# Altium project Karta_Radiowa_ILS_TETRA.PrjPcb (part 7 of 9)

## Sheet Tor_330MHz.SchDoc
size A3; Organization: Altium Limited; Address1: L3, 12a Rodborough Rd; Address2: Frenchs Forest; Address3: NSW; Address4: Australia 2086; SheetNumber: 17; SheetTotal: 17
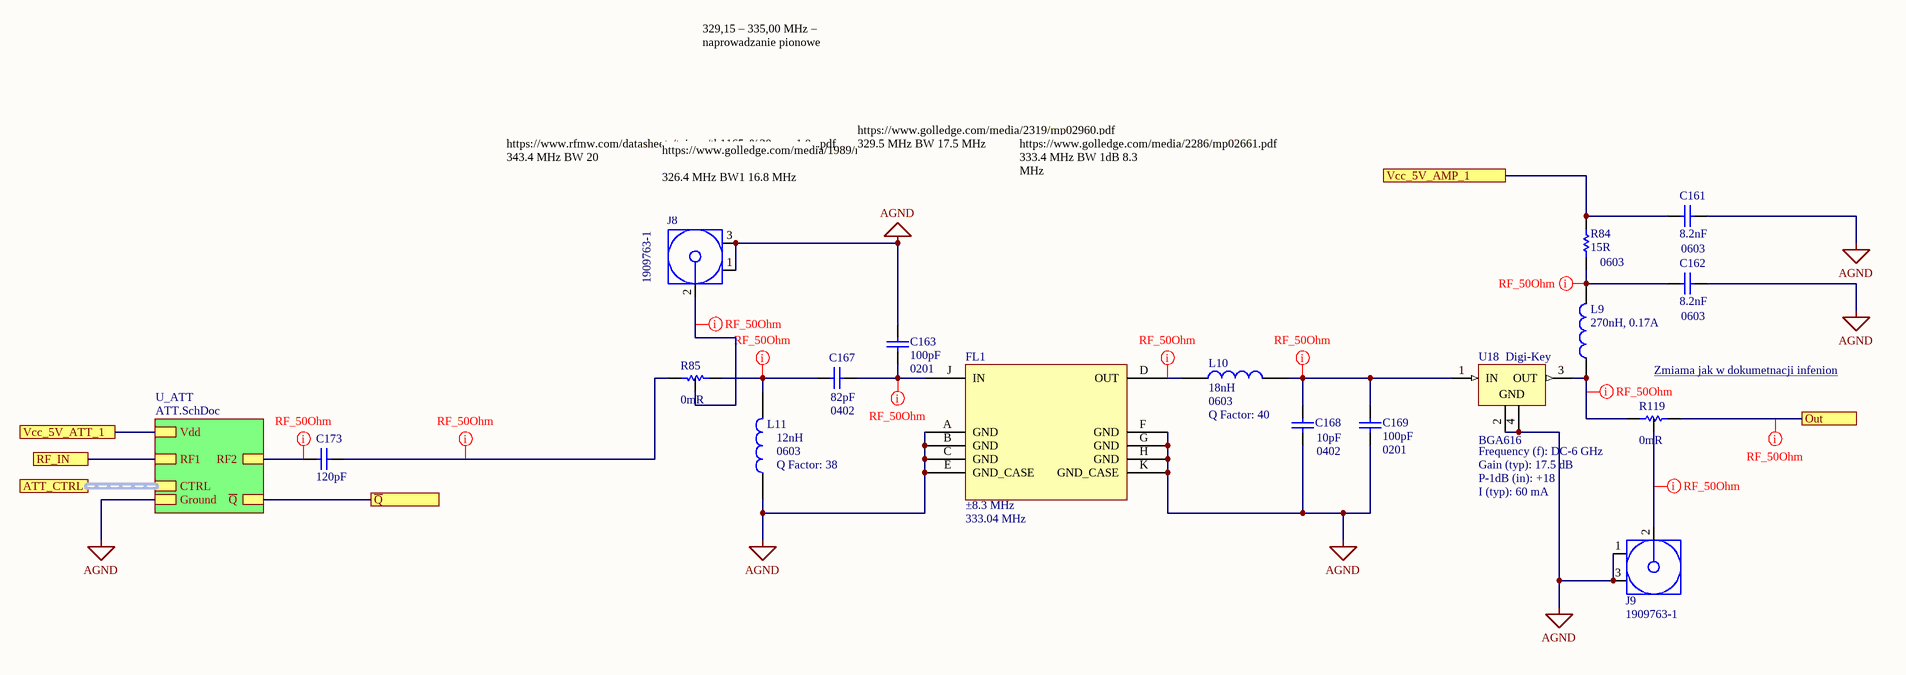
[diagram p9: Tor_330MHz.SchDoc]

### Parts
C161  8.2nF  Case/Package: 0603  [CAP 0603/1608 RF]
C162  8.2nF  Case/Package: 0603  [CAP 0603/1608 RF]
C163  100pF  Case/Package: 0201  [CAP 0201/0603 KK]
C167  82pF  Case/Package: 0402  [CAP 0402/1005 RF KK]
C168  10pF  Case/Package: 0402  [CAP 0402/1005 RF KK]
C169  100pF  Case/Package: 0201  [CAP 0201/0603 KK]
C173  120pF  [CAP 0402/1005 RF KK]
FL1  Bandwidth 1dB: ±8.3 MHz  Center frequency: 333.04 MHz  [TB0787A]  (hidden comment: SAW TB0787A)
J8  1909763-1  [TECO-1909763-1_V]
J9  1909763-1  [TECO-1909763-1_V]
L9  270nH, 0.17A  [WE-KI_0603]
L10  18nH  Case/Package: 0603  Q Factor: 40  [FB0603]
L11  12nH  Case/Package: 0603  Q Factor: 38  [FB0603]
R84  15R  Case/Package: 0603  [RES 0603/1608 RF]
R85  0mR  [RES 0402/1005 RF - 3-PADS]
R119  0mR  [RES 0402/1005 RF - 3-PADS]
U18  BGA616  Frequency (f): DC-6 GHz  Gain (typ): 17.5 dB  I (typ): 60 mA  P-1dB (in): +18  Supplier 2: Digi-Key  [INF-SOT343_V]

### Sub-sheets
U_ATT = ATT.SchDoc: Vdd, Ground, RF1, RF2, CTRL (harness ATT_Controle), ~{Q}

### Ports
ATT_CTRL, Out, RF_IN, Vcc_5V_AMP_1, Vcc_5V_ATT_1, ~{Q}

### Nets
AGND: C161.2 C162.2 C163.1 C168.1 C169.1 FL1.A(GND) FL1.B(GND) FL1.C(GND) FL1.E(GND_CASE) FL1.F(GND) FL1.G(GND) FL1.H(GND) FL1.K(GND_CASE) J8.1 J8.3 J9.1 J9.3 L11.1 U18.2(GND) U18.4(GND) ; sheet U_ATT/Ground  [project net GND_ATT]
~{Q}: port ~{Q}, sheet U_ATT/~{Q}
Vcc_5V_AMP_2: C161.1 R84.2 ; port Vcc_5V_AMP_1
Vcc_5V_ATT_2: port Vcc_5V_ATT_1, sheet U_ATT/Vdd
NetC162_1: C162.1 L9.2 R84.1
NetC163_2: C163.2 C167.2 FL1.J(IN)
NetC164_1: R119.1 ; port Out
NetC167_1: C167.1 L11.2 R85.2
NetC168_2: C168.2 C169.2 L10.2 U18.1(IN)
NetC173_1: C173.1 ; sheet U_ATT/RF2
NetC173_2: C173.2 R85.1
NetFL1_D: FL1.D(OUT) L10.1
NetJ8_2: J8.2 R85.3
NetJ9_2: J9.2 R119.3
NetL9_1: L9.1 R119.2 U18.3(OUT)
NetR9_U_RF_ANT_M_2: port RF_IN, sheet U_ATT/RF1

### Buses and harness runs
harness port ATT_CTRL = sheet U_ATT/CTRL

### Layout directives
net class Single50: NetC162_1, NetC163_2, NetC164_1, NetC167_1, NetC168_2, NetC173_1, NetC173_2, NetFL1_D, NetJ8_2, NetJ9_2, NetL9_1

### Notes on the sheet
- 329,15 – 335,00 MHz – naprowadzanie pionowe
- https://www.golledge.com/media/2319/mp02960.pdf
  329.5 MHz BW 17.5 MHz
- https://www.rfmw.com/datasheets/taisaw/tb1165a%20_rev.1.0_.pdf
  343.4 MHz BW 20
- (near J8) https://www.golledge.com/media/1989/ma08024.pdf
  326.4 MHz BW1 16.8 MHz
- https://www.golledge.com/media/2286/mp02661.pdf
  333.4 MHz BW 1dB 8.3 MHz
- (near R119) Zmiama jak w dokumetnacji infenion <https://www.infineon.com/dgdl/AN098.pdf?fileId=db3a30431441fb5d0114b6641c751744>
- Title
- Size:
- Date:
- A3
- Number:
- Time:
- Revision:
- Sheet
- of
- File:

### Library data of the parts
C161 C162 = Capacitor: Multilayer Ceramic Capacitors MLCC - SMD/SMT 0603 8,200pF 50volts C0G +/-5%; Manufacturer: Murata; Manufacturer Part Number: GRM1885C1H822JA01D; Voltage Rating: 50V; Tolerance: 5%; Supplier 1: Digi-Key; Supplier Part Number 1: 490-11482-1-ND; RoHS: Yes; Category: Ceramic Capacitors; Stock 1: 65615; Pricing 1: 1=0,21000, 10=0,14200, 50=0,08500, 100=0,07170, 500=0,04908, 1000=0,04341 (USD); Mount: Surface Mount; Case Code (Imperial): 0603; Case Code (Metric): 1608; Min Operating Temperature: -55°C; Max Operating Temperature: 125°C; Dielectric: C0G; Capacitance: 8.2nF; Voltage Rating (DC): 50V; Packaging: Tape and Reel; Package Quantity: 4000; Termination: SMD/SMT; Length: 0.063inch; Height: 0.8mm; Width: 0.031inch; Thickness: 0.035inch; ComponentLink1URL: https://datasheet.ciiva.com/29537/partnumbering-e-01-29537913.pdf?src-supplier=Digi-Key; ComponentLink1Description: https://datasheet.ciiva.com/29537/partnumbering-e-01-29537913.pdf?src-supplier=Digi-Key
C163 C169 = Capacitor: Multilayer Ceramic Capacitors MLCC - SMD/SMT 0201 100pF 25volts C0G +/-5%; Manufacturer: Murata; Manufacturer Part Number: GRM0335C1E101JA01D; Tolerance: 5%; Voltage: 25V; Supplier 1: Digi-Key; Supplier Part Number 1: 490-3160-1-ND; RoHS: Yes; Category: Ceramic Capacitors; Stock 1: 270262; Pricing 1: 1=0,10000, 10=0,01300, 100=0,00560, 500=0,00400, 1000=0,00315, 2500=0,00286, 5000=0,00263 (USD); Mount: Surface Mount; Case Code (Metric): 0603; Case Code (Imperial): 0201; Min Operating Temperature: -55°C; Max Operating Temperature: 125°C; Dielectric: C0G; Capacitance: 100pF; Termination: SMD/SMT; Package Quantity: 15000; Packaging: Tape and Reel; Voltage Rating: 25V; Voltage Rating (DC): 25V; Length: 0.6mm; Height: 0.3mm; Thickness: 0.013inch; Depth: 0.3mm; Width: 0.012inch; Radiation Hardening: No; REACH SVHC: No SVHC; Lead Free: Lead Free; ComponentLink1URL: https://datasheet.ciiva.com/16497/grm0335c1e101ja01-01-16497112.pdf?src-supplier=Future+Electronics; ComponentLink1Description: https://datasheet.ciiva.com/16497/grm0335c1e101ja01-01-16497112.pdf?src-supplier=Future+Electronics; ComponentLink2URL: https://datasheet.ciiva.com/18697/product-18697797.pdf?src-supplier=Digi-Key; ComponentLink2Description: https://datasheet.ciiva.com/18697/product-18697797.pdf?src-supplier=Digi-Key
C167 = Capacitor: CERAMIC CAPACITOR, 82PF, 25V, C0G/NP0, 0402; Product Range:VJ HIFREQ Series; Capacitance:82pF; Capacitance Tolerance: 5%; Dielectric Characteristic:C0G / NP0; Voltage Rating:25V; Ceramic Capacitor Case:0402 [1005 Metric] ;RoHS Compliant: Yes; Manufacturer: Vishay Vitramon; Manufacturer Part Number: VJ0402D820JXXAJ; Dielectric: C0G; Temperature Coefficient: 30ppm/°C; Supplier 1: Digi-Key; Supplier Part Number 1: 720-1297-1-ND; RoHS: Yes; Category: Ceramic Capacitors; Stock 1: 90328; Pricing 1: 1=0,52000, 10=0,36500, 50=0,27620, 100=0,24060, 500=0,17820 (USD); Mount: Surface Mount,PCB; Weight: 2.3E-05oz; Case Code (Imperial): 0402; Case Code (Metric): 1005; Min Operating Temperature: -55°C; Max Operating Temperature: 125°C; Packaging: Tape and Reel; Package Quantity: 1; Termination: SMD/SMT; Capacitance: 82pF; Tolerance: 5%; Voltage Rating: 25V; Voltage Rating (DC): 25V; Voltage: 25V; Length: 1.02mm; Height: 0.61mm; Width: 0.51mm; Thickness: 0.024inch; Depth: 0.51mm; Radiation Hardening: No; REACH SVHC: Unknown; Lead Free: Lead Free; ComponentLink1URL: https://datasheet.ciiva.com/30503/0900766b812428e7-30503890.pdf?src-supplier=RSComponents; ComponentLink1Description: https://datasheet.ciiva.com/30503/0900766b812428e7-30503890.pdf?src-supplier=RSComponents; ComponentLink2URL: https://datasheet.ciiva.com/16511/vj0402dseries-16511415.pdf?src-supplier=Future+Electronics; ComponentLink2Description: https://datasheet.ciiva.com/16511/vj0402dseries-16511415.pdf?src-supplier=Future+Electronics; ComponentLink3URL: https://datasheet.ciiva.com/6286/vjhifreq-6286552.pdf?src-supplier=Digi-Key; ComponentLink3Description: https://datasheet.ciiva.com/6286/vjhifreq-6286552.pdf?src-supplier=Digi-Key; ComponentLink4URL: https://datasheet.ciiva.com/7974/1631376-7974937.pdf?src-supplier=Element14; ComponentLink4Description: https://datasheet.ciiva.com/7974/1631376-7974937.pdf?src-supplier=Element14; ComponentLink5URL: https://datasheet.ciiva.com/6286/vjhifreq-6286555.pdf?src-supplier=Digi-Key; ComponentLink5Description: https://datasheet.ciiva.com/6286/vjhifreq-6286555.pdf?src-supplier=Digi-Key; ComponentLink6URL: https://datasheet.ciiva.com/49031/70396551-49031980.pdf?src-supplier=Allied+Electronics; ComponentLink6Description: https://datasheet.ciiva.com/49031/70396551-49031980.pdf?src-supplier=Allied+Electronics; ComponentLink7URL: https://datasheet.ciiva.com/6286/vjhifreq-6286558.pdf?src-supplier=Digi-Key; ComponentLink7Description: https://datasheet.ciiva.com/6286/vjhifreq-6286558.pdf?src-supplier=Digi-Key
C168 = Capacitor: KEMET - CBR04C100F5GAC - Capacitor, RF, 10 pF, 50 V, HiQ-CBR Series, ± 1%, 125 °C, 0402 [1005 Metric]; Voltage Rating: 50V; Dielectric: C0G; Supplier 1: Digi-Key; Supplier Part Number 1: 399-8805-1-ND; Manufacturer: KEMET; Manufacturer Part Number: CBR04C100F5GAC; RoHS: Yes; Category: Ceramic Capacitors; Stock 1: 134697; Pricing 1: 1=0,23000, 10=0,15500, 50=0,09300, 100=0,07860, 500=0,05376, 1000=0,04756, 2500=0,04550, 5000=0,04136 (USD); Mount: Surface Mount; Case Code (Metric): 1005; Case Code (Imperial): 0402; Min Operating Temperature: -55°C; Max Operating Temperature: 125°C; Package Quantity: 10000; Capacitance: 10pF; Tolerance: 1%; Packaging: Cut Tape; Voltage Rating (DC): 50V; Length: 0.039inch; Width: 0.02inch; Thickness: 0.022inch; REACH SVHC: No SVHC; ComponentLink1URL: https://datasheet.ciiva.com/6276/kem-c1030-cbr-smd-6276869.pdf?src-supplier=Digi-Key; ComponentLink1Description: https://datasheet.ciiva.com/6276/kem-c1030-cbr-smd-6276869.pdf?src-supplier=Digi-Key; ComponentLink2URL: https://datasheet.ciiva.com/6276/kem-c1030-cbr-smd-6276872.pdf?src-supplier=Digi-Key; ComponentLink2Description: https://datasheet.ciiva.com/6276/kem-c1030-cbr-smd-6276872.pdf?src-supplier=Digi-Key; ComponentLink3URL: https://datasheet.ciiva.com/6276/kem-c1030-cbr-smd-6276875.pdf?src-supplier=Digi-Key; ComponentLink3Description: https://datasheet.ciiva.com/6276/kem-c1030-cbr-smd-6276875.pdf?src-supplier=Digi-Key
C173 = Capacitor: CAP CER 120PF 25V C0G/NP0 0402; Manufacturer: KEMET; Manufacturer Part Number: C0402C121J3GAC7867; Tolerance: 5%; Supplier 1: Digi-Key; Supplier Part Number 1: 399-14880-1-ND; RoHS: No; Category: Ceramic Capacitors; Stock 1: 43311; Pricing 1: 1=0,10000, 10=0,04100, 50=0,02260, 100=0,01840, 500=0,01312, 1000=0,01032, 2500=0,00938, 5000=0,00863 (USD); Mount: Surface Mount; Case/Package: 0402; Case Code (Imperial): 0402; Case Code (Metric): 1005; Min Operating Temperature: -55°C; Max Operating Temperature: 125°C; Packaging: Tape and Reel; Capacitance: 120pF; Voltage Rating: 25V; ComponentLink1URL: https://api.kemet.com/component-edge/download/datasheet/C0402C121J3GAC7867.pdf?src-supplier=Digi-Key; ComponentLink1Description: https://api.kemet.com/component-edge/download/datasheet/C0402C121J3GAC7867.pdf?src-supplier=Digi-Key
FL1 = SAW TB0787A: SAW Filter 333.04MHz / Model: TB0787A / Part No: MP02661; Source Power: 10 dBm; ComponentLink1Description: Datasheet; ComponentLink1URL: https://www.golledge.com/media/2286/mp02661.pdf
J8 J9 = 1909763-1: Ultra Miniature Coaxial Connector Jack, 60 V, 50 Ohm, -40 to 90 degC, RoHS, Tape and Reel; Brand: TE Connectivity / AMP; Maximum Frequency: 6 GHz; Gender: Jack (Female); Body Material: Liquid Crystal Polymer (LCP); RF Series: UMCC; Impedance: 50 Ohms; DatasheetVersion: Rev. B2; PackageReference: SMD; PackageDescription: 3-Pin Surface Mount Device, Body 2.6 x 2.6 mm; Supplier 1: Newark; Supplier Part Number 1: 62X0488; Supplier 2: Farnell; Supplier Part Number 2: 2781689; Supplier 3: Digi-Key; Supplier Part Number 3: A118077TR-ND; Supplier 4: Digi-Key; Supplier Part Number 4: A118077CT-ND; Supplier 5: Digi-Key; Supplier Part Number 5: A118077DKR-ND; Product Category: RF Connectors / Coaxial Connectors; Packaging: Reel; Product: Connectors; Orientation: Straight; Operating Temperature Range: - 40 C to + 90 C; Factory Pack Quantity: 5000; RoHS: Details; Contact Plating: Gold; Contact Material: Copper Alloy; Mounting Technology: Surface Mount; ComponentLink1Description: Manufacturer URL; ComponentLink1URL: http://www.te.com; ComponentLink2Description: Datasheet; ComponentLink2URL: http://www.te.com/commerce/DocumentDelivery/DDEController?Action=srchrtrv&DocNm=1909763&DocType=Customer+Drawing&DocLang=English
L9 = 744761227A: Wurth WE-KI Series Shielded Wire-wound SMD Inductor with a Ceramic Core, 270 nH 170mA Idc Q:30; Manufacturer: Wurth Elektronik; Q-Factor min.: 30; Inductance Tolerance: +/-5%; DC Resistance max.: 1.8Ohm; Self Resonant Frequency: 1000MHz; ComponentLink1Description: Manufacturer; ComponentLink1URL: http://www.we-online.de; ComponentLink2Description: Datasheet; ComponentLink2URL: https://www.we-online.com/catalog/datasheet/744761227A.pdf; Published Date: April 2020; Rated Current: 0.17A; Packaging: Tape and Reel; Operating Temperature: -40 to +125degC; Manufacturer Part Number: 744761227A; Size: 0603; Inductance: 270nH; Mounting Technology: SMT; Supplier 1: Digi-Key; Supplier Part Number 1: 732-744761227ACT-ND; RoHS: No; Category: Fixed Inductors; Stock 1: 2580; Pricing 1: 1=0,28000, 10=0,24700, 100=0,22800, 500=0,20900, 1000=0,19300 (USD)
L10 = Inductor: Inductor RF Chip Wirewound 18nH 2% 100MHz 40Q-Factor 550mA 160mOhm DCR 0603 T/R; Manufacturer: Murata; Manufacturer Part Number: LQW18AN18NG00D; Self Resonant Frequency: 5.5GHz; Shielding: Unshielded; Current: 420mA; DC Resistance (DCR): 160mR; Supplier 1: Digi-Key; Supplier Part Number 1: 490-6870-1-ND; RoHS: Yes; Category: Fixed Inductors; Stock 1: 44079; Pricing 1: 1=0,17000, 10=0,15700, 25=0,14000, 50=0,11900, 100=0,10490, 250=0,09620, 500=0,08746, 1000=0,07346 (USD); Mount: Surface Mount; Weight: 0.000106oz; Case Code (Imperial): 0603; Case Code (Metric): 1608; Min Operating Temperature: -55°C; Max Operating Temperature: 125°C; Tolerance: 2%; Inductance Tolerance: 2%; Packaging: Tape and Reel; Inductance: 18nH; Package Quantity: 4000; Max DC Current: 550mA; Current Rating: 550mA; Termination: SMD/SMT; Test Frequency: 100MHz; Composition: Wirewound; DC Current: 550mA; Military Standard: Not; Series Resistance: 160mR; Length: 1.6mm; Height: 0.8mm; Width: 0.8mm; Depth: 1mm; Radiation Hardening: No; Lead Free: Lead Free; REACH SVHC: No SVHC; ComponentLink1URL: https://datasheet.ciiva.com/11801/0900766b80a002db-11801456.pdf?src-supplier=RSComponents; ComponentLink1Description: https://datasheet.ciiva.com/11801/0900766b80a002db-11801456.pdf?src-supplier=RSComponents; ComponentLink2URL: https://datasheet.ciiva.com/14124/qhlqw18a-data-e-14124618.pdf?src-supplier=Distrelec; ComponentLink2Description: https://datasheet.ciiva.com/14124/qhlqw18a-data-e-14124618.pdf?src-supplier=Distrelec; ComponentLink3URL: https://datasheet.ciiva.com/16216/l0075s0080lqw18a-00-16216442.pdf?src-supplier=Future+Electronics; ComponentLink3Description: https://datasheet.ciiva.com/16216/l0075s0080lqw18a-00-16216442.pdf?src-supplier=Future+Electronics; ComponentLink4URL: https://datasheet.ciiva.com/6709/l0075s0080lqw18a-00-6709815.pdf?src-supplier=Digi-Key; ComponentLink4Description: https://datasheet.ciiva.com/6709/l0075s0080lqw18a-00-6709815.pdf?src-supplier=Digi-Key; ComponentLink5URL: https://datasheet.ciiva.com/6709/l0075s0080lqw18a-00-6709816.pdf?src-supplier=Digi-Key; ComponentLink5Description: https://datasheet.ciiva.com/6709/l0075s0080lqw18a-00-6709816.pdf?src-supplier=Digi-Key; ComponentLink6URL: https://datasheet.ciiva.com/17278/l0075s0080lqw18a-00-17278376.pdf?src-supplier=Avnet+Europe; ComponentLink6Description: https://datasheet.ciiva.com/17278/l0075s0080lqw18a-00-17278376.pdf?src-supplier=Avnet+Europe; ComponentLink7URL: https://datasheet.ciiva.com/6709/l0075s0080lqw18a-00-6709818.pdf?src-supplier=Digi-Key; ComponentLink7Description: https://datasheet.ciiva.com/6709/l0075s0080lqw18a-00-6709818.pdf?src-supplier=Digi-Key
L11 = Inductor: FIXED IND 12NH 750MA 71 MOHM SMD; Manufacturer: Murata; Manufacturer Part Number: LQW18AN12NJ10D; Core Material: Non-Magnetic; Current: 550mA; DC Resistance (DCR): 71mR; Test Frequency: 100MHz; Tolerance: 5%; Shielding: Unshielded; Self Resonant Frequency: 5GHz; Supplier 1: Digi-Key; Supplier Part Number 1: 490-6863-1-ND; RoHS: Yes; Category: Fixed Inductors; Stock 1: 1061; Pricing 1: 1=0,17000, 10=0,15700, 25=0,14000, 50=0,11900, 100=0,10490, 250=0,09620, 500=0,08746, 1000=0,07346 (USD); Mount: Surface Mount; Weight: 0.000106oz; Case Code (Imperial): 0603; Case Code (Metric): 1608; Min Operating Temperature: -55°C; Max Operating Temperature: 125°C; Inductance: 12nH; Max DC Current: 750mA; Termination: SMD/SMT; Composition: Wirewound; DC Current: 750mA; Military Standard: Not; Packaging: Tape and Reel; Package Quantity: 4000; Current Rating: 750mA; Length: 1.6mm; Height: 0.8mm; Height - Seated (Max): 0.039inch; Depth: 1.1mm; Width: 0.8mm; Radiation Hardening: No; Lead Free: Lead Free; ComponentLink1URL: https://datasheet.ciiva.com/16390/lqw18an12nj10d-16390352.pdf?src-supplier=Future+Electronics; ComponentLink1Description: https://datasheet.ciiva.com/16390/lqw18an12nj10d-16390352.pdf?src-supplier=Future+Electronics; ComponentLink2URL: https://datasheet.ciiva.com/11801/0900766b80a002db-11801464.pdf?src-supplier=RSComponents; ComponentLink2Description: https://datasheet.ciiva.com/11801/0900766b80a002db-11801464.pdf?src-supplier=RSComponents; ComponentLink3URL: https://datasheet.ciiva.com/6705/l0075s0080lqw18a-10-6705450.pdf?src-supplier=Digi-Key; ComponentLink3Description: https://datasheet.ciiva.com/6705/l0075s0080lqw18a-10-6705450.pdf?src-supplier=Digi-Key; ComponentLink4URL: https://datasheet.ciiva.com/6705/l0075s0080lqw18a-10-6705453.pdf?src-supplier=Digi-Key; ComponentLink4Description: https://datasheet.ciiva.com/6705/l0075s0080lqw18a-10-6705453.pdf?src-supplier=Digi-Key; ComponentLink5URL: https://datasheet.ciiva.com/6705/l0075s0080lqw18a-10-6705454.pdf?src-supplier=Digi-Key; ComponentLink5Description: https://datasheet.ciiva.com/6705/l0075s0080lqw18a-10-6705454.pdf?src-supplier=Digi-Key
R84 = Resistor: RES SMD 15 OHM 0.5% 1/16W 0603; Manufacturer: Susumu; Manufacturer Part Number: RR0816Q-150-D; Power Rating: 63mW; Voltage Rating: 75V; Temperature Coefficient: 50ppm/°C; Supplier 1: Digi-Key; Supplier Part Number 1: RR08Q15DCT-ND; RoHS: Yes; Category: Chip SMD Resistors; Stock 1: 15480; Pricing 1: 1=0,10000, 10=0,09300, 100=0,03580, 1000=0,01575, 2500=0,01360 (USD); Number of Pins: 2; Case Code (Imperial): 0603; Case Code (Metric): 1608; Min Operating Temperature: -55°C; Max Operating Temperature: 125°C; Resistance: 15R; Packaging: Tape and Reel; Tolerance: 0.5%; Package Quantity: 1; Termination: SMD/SMT; Resistor Type: Thin Film; Number of Terminations: 2; Max Power Dissipation: 63mW; Voltage Rating (DC): 75V; Length: 1.6mm; Height: 0.4mm; Width: 0.8mm; Depth: 0.8mm; REACH SVHC: Unknown; Lead Free: Lead Free; ComponentLink1URL: https://datasheet.ciiva.com/11820/0900766b80808d64-11820652.pdf?src-supplier=RSComponents; ComponentLink1Description: https://datasheet.ciiva.com/11820/0900766b80808d64-11820652.pdf?src-supplier=RSComponents; ComponentLink2URL: https://datasheet.ciiva.com/2497/rr-data-sheet-2497981.pdf?src-supplier=Digi-Key; ComponentLink2Description: https://datasheet.ciiva.com/2497/rr-data-sheet-2497981.pdf?src-supplier=Digi-Key; ComponentLink3URL: https://datasheet.ciiva.com/2497/rr-data-sheet-2497982.pdf?src-supplier=Digi-Key; ComponentLink3Description: https://datasheet.ciiva.com/2497/rr-data-sheet-2497982.pdf?src-supplier=Digi-Key; ComponentLink4URL: https://datasheet.ciiva.com/2497/rr-data-sheet-2497983.pdf?src-supplier=Digi-Key; ComponentLink4Description: https://datasheet.ciiva.com/2497/rr-data-sheet-2497983.pdf?src-supplier=Digi-Key
R85 R119 = Resistor: YAGEO - RC0402JR-070RL. - RES, THICK FILM, 0R, 0.0625W, 0402; Power Rating: 62.5mW; Tolerance: 5%; Max Power Dissipation: 63mW; Temperature Coefficient: 200ppm/°C; Voltage Rating: 50V; Supplier 1: Digi-Key; Supplier Part Number 1: 311-0.0JRDKR-ND; Manufacturer: Yageo; Manufacturer Part Number: RC0402JR-070RL; RoHS: Yes; Category: Chip SMD Resistors; Stock 1: 19267045; Pricing 1: 1=0,10000, 10=0,01300, 25=0,00920, 50=0,00720, 100=0,00530, 250=0,00400, 500=0,00320, 1000=0,00236, 5000=0,00169 (USD); Case/Package: 0402; Contact Plating: Tin,Matte; Case Code (Metric): 1005; Case Code (Imperial): 0402; Min Operating Temperature: -55°C; Max Operating Temperature: 155°C; Resistance: 0mR; Packaging: Tape and Reel; Composition: Thick Film; Package Quantity: 1; Number of Terminations: 2; Termination: SMD/SMT; Military Standard: Not; Features: Moisture Resistant; Length: 1mm; Height: 0.016inch; Width: 0.02inch; Depth: 0.5mm; Radiation Hardening: No; Lead Free: Lead Free; REACH SVHC: Unknown; ComponentLink1URL: https://datasheet.ciiva.com/2452/pyu-rc0402-51-rohs-l-6-2452608.pdf?src-supplier=Digi-Key; ComponentLink1Description: https://datasheet.ciiva.com/2452/pyu-rc0402-51-rohs-l-6-2452608.pdf?src-supplier=Digi-Key; ComponentLink2URL: https://datasheet.ciiva.com/11808/0900766b80c66297-11808195.pdf?src-supplier=RSComponents; ComponentLink2Description: https://datasheet.ciiva.com/11808/0900766b80c66297-11808195.pdf?src-supplier=RSComponents; ComponentLink3URL: https://datasheet.ciiva.com/2452/pyu-r-int-thick-7-2452609.pdf?src-supplier=Digi-Key; ComponentLink3Description: https://datasheet.ciiva.com/2452/pyu-r-int-thick-7-2452609.pdf?src-supplier=Digi-Key; ComponentLink4URL: https://datasheet.ciiva.com/2452/pyu-r-int-thick-7-2452610.pdf?src-supplier=Digi-Key; ComponentLink4Description: https://datasheet.ciiva.com/2452/pyu-r-int-thick-7-2452610.pdf?src-supplier=Digi-Key; ComponentLink5URL: https://datasheet.ciiva.com/8896/pyu-rc0402-51-rohs-l-6-8896201.pdf?src-supplier=Avnet; ComponentLink5Description: https://datasheet.ciiva.com/8896/pyu-rc0402-51-rohs-l-6-8896201.pdf?src-supplier=Avnet; ComponentLink6URL: https://datasheet.ciiva.com/28386/pyu-rc0402-51-rohs-l-6-28386633.pdf?src-supplier=Avnet+Europe; ComponentLink6Description: https://datasheet.ciiva.com/28386/pyu-rc0402-51-rohs-l-6-28386633.pdf?src-supplier=Avnet+Europe; ComponentLink7URL: https://datasheet.ciiva.com/22747/1018594-22747515.pdf?src-supplier=Element14; ComponentLink7Description: https://datasheet.ciiva.com/22747/1018594-22747515.pdf?src-supplier=Element14; ComponentLink8URL: https://datasheet.ciiva.com/15189/getdatasheetpartid-326379-15189533.pdf?src-supplier=Verical; ComponentLink8Description: https://datasheet.ciiva.com/15189/getdatasheetpartid-326379-15189533.pdf?src-supplier=Verical; ComponentLink9URL: https://datasheet.ciiva.com/7983/1018594-7983535.pdf?src-supplier=Element14; ComponentLink9Description: https://datasheet.ciiva.com/7983/1018594-7983535.pdf?src-supplier=Element14
U18 = BGA616: Silicon Germanium Broadband MMIC Amplifier, DC-6 GHz, 17.5 dB Gain, SOT343, Green; Manufacturer: Infineon; F (typ): 2.9 dB; Green: yes; DatasheetVersion: Rev. 2.1; PackageReference: SOT343; PackageDescription: 4-Pin Small Outline Transistor Package, 1.25 x 2 mm Body; Supplier 1: Mouser; Supplier Part Number 1: N/A; Halogen-free: yes; Mounting Technology: Surface Mount; PartNumber: BGA616; ComponentLink1Description: Manufacturer URL; ComponentLink1URL: http://www.infineon.com/; ComponentLink2Description: Datasheet; ComponentLink2URL: http://www.infineon.com/dgdl/BGA616.pdf?folderId=db3a30431441fb5d0114b654e6581730&fileId=db3a304314dca3890115419102bb163b&location=en.Products.RF.RF_MMIC.CATV___Broadband_Amplifier.DATASHEET.BGA616.pdf; ComponentLink3Description: Package Specification; ComponentLink3URL: http://www.infineon.com/dgdl/SOT343-Package_Overview.pdf?folderId=db3a30431936bc4b0119535155343cba&fileId=db3a30431936bc4b0119535a9f393cd3; Supplier Part Number 2: BGA616H6327XTSA1CT-ND

## Sheet POWER_ADC.SchDoc: ADC Supply
size A3; SheetNumber: 8; SheetTotal: 17
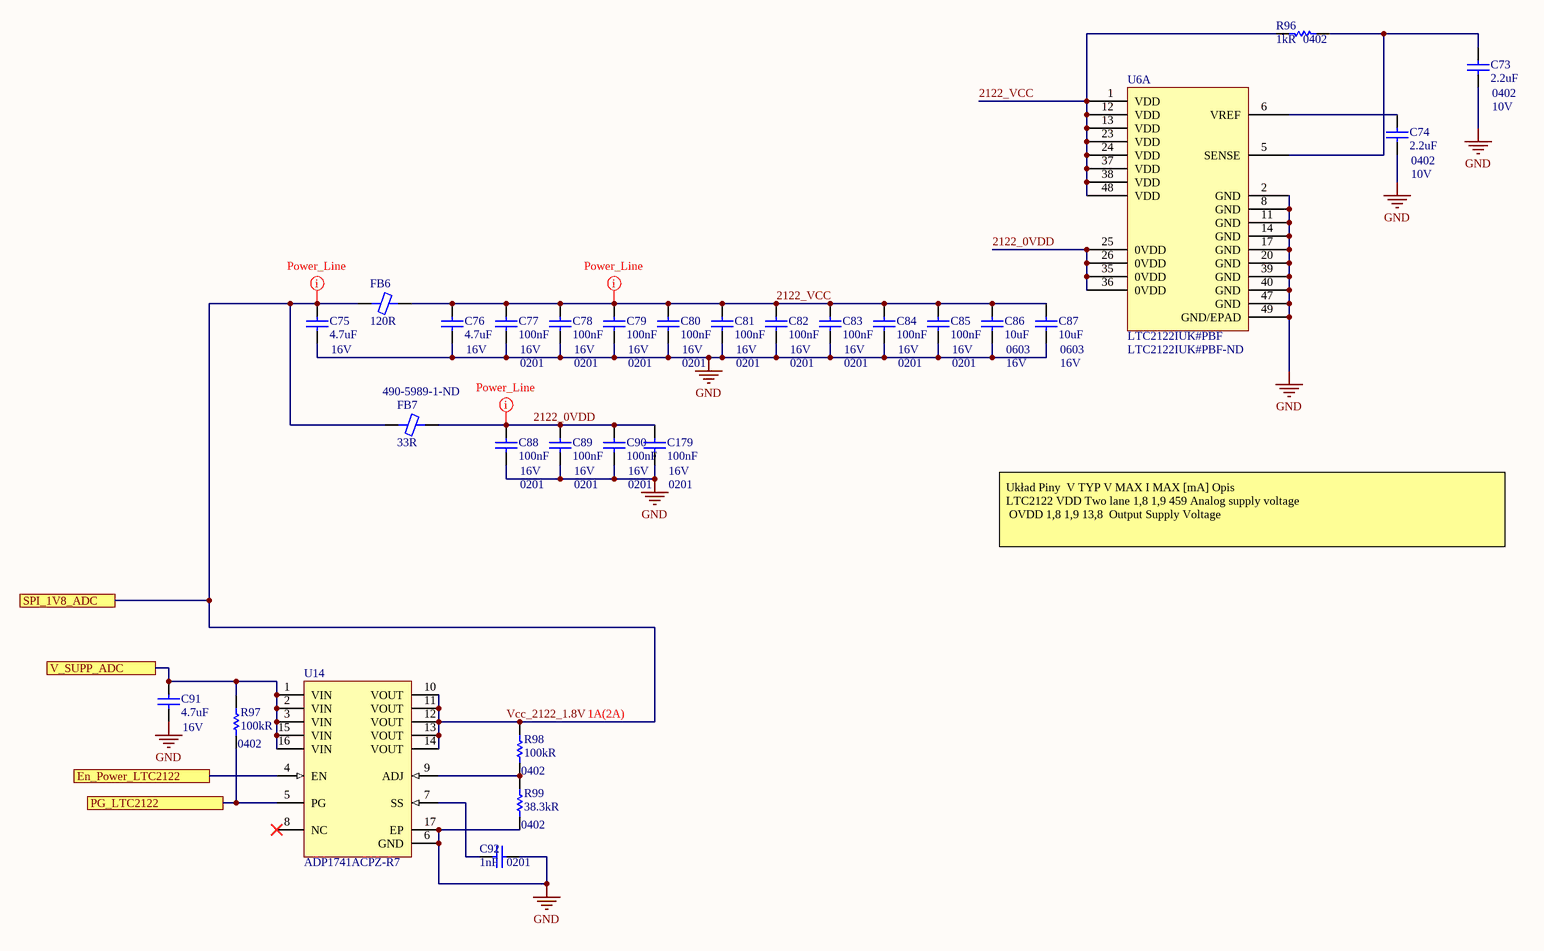
[diagram p10: POWER_ADC.SchDoc]

### Parts
C73  2.2uF  Case Code (Imperial): 0402  Voltage Rating: 10V  [CAP 0402/1005 RF KK]
C74  2.2uF  Case Code (Imperial): 0402  Voltage Rating: 10V  [CAP 0402/1005 RF KK]
C75  4.7uF  Voltage: 16V  [CAP 0603/1608 RF]
C76  4.7uF  Voltage: 16V  [CAP 0603/1608 RF]
C77  100nF  Case/Package: 0201  Voltage Rating: 16V  [CAP 0201/0603 KK]
C78  100nF  Case/Package: 0201  Voltage Rating: 16V  [CAP 0201/0603 KK]
C79  100nF  Case/Package: 0201  Voltage Rating: 16V  [CAP 0201/0603 KK]
C80  100nF  Case/Package: 0201  Voltage Rating: 16V  [CAP 0201/0603 KK]
C81  100nF  Case/Package: 0201  Voltage Rating: 16V  [CAP 0201/0603 KK]
C82  100nF  Case/Package: 0201  Voltage Rating: 16V  [CAP 0201/0603 KK]
C83  100nF  Case/Package: 0201  Voltage Rating: 16V  [CAP 0201/0603 KK]
C84  100nF  Case/Package: 0201  Voltage Rating: 16V  [CAP 0201/0603 KK]
C85  100nF  Case/Package: 0201  Voltage Rating: 16V  [CAP 0201/0603 KK]
C86  10uF  Case/Package: 0603  Voltage Rating: 16V  [CAP 0603/1608 RF]
C87  10uF  Case/Package: 0603  Voltage Rating: 16V  [CAP 0603/1608 RF]
C88  100nF  Case/Package: 0201  Voltage Rating: 16V  [CAP 0201/0603 KK]
C89  100nF  Case/Package: 0201  Voltage Rating: 16V  [CAP 0201/0603 KK]
C90  100nF  Case/Package: 0201  Voltage Rating: 16V  [CAP 0201/0603 KK]
C91  4.7uF  Voltage: 16V  [CAP 0603/1608 RF]
C92  1nF  Case/Package: 0201  [CAP 0201/0603 KK]
C179  100nF  Case/Package: 0201  Voltage Rating: 16V  [CAP 0201/0603 KK]
FB6  120R  [FER 0402/1005 KK]
FB7  33R  Supplier Part Number 1: 490-5989-1-ND  [FB1206]
R96  1kR  Case/Package: 0402  [RES 0402/1005 RF KK]
R97  100kR  Case/Package: 0402  [RES 0402/1005 RF KK]
R98  100kR  Case/Package: 0402  [RES 0402/1005 RF KK]
R99  38.3kR  Case/Package: 0402  [RES 0402/1005 RF KK]
U6  LTC2122IUK#PBF  Supplier Part Number 1: LTC2122IUK#PBF-ND  [LTC2122]  (part A of 2)
U14  ADP1741ACPZ-R7  [ADI-CP-16-13_M]

### Ports
En_Power_LTC2122, PG_LTC2122, SPI_1V8_ADC, V_SUPP_ADC

### Nets
GND: C73.1 C74.1 C75.1 C76.1 C77.1 C78.1 C79.1 C80.1 C81.1 C82.1 C83.1 C84.1 C85.1 C86.1 C87.1 C88.1 C89.1 C90.1 C91.1 C92.2 C179.1 R99.1 U6.2(GND) U6.8(GND) U6.11(GND) U6.14(GND) U6.17(GND) U6.20(GND) U6.39(GND) U6.40(GND) U6.47(GND) U6.49(GND/EPAD) U14.6(GND) U14.17(EP)
3V6_DCDC: C91.2 R97.2 U14.1(VIN) U14.2(VIN) U14.3(VIN) U14.15(VIN) U14.16(VIN) ; port V_SUPP_ADC
2122_0VDD: C88.2 C89.2 C90.2 C179.2 FB7.2 U6.25(0VDD) U6.26(0VDD) U6.35(0VDD) U6.36(0VDD)
2122_VCC: C76.2 C77.2 C78.2 C79.2 C80.2 C81.2 C82.2 C83.2 C84.2 C85.2 C86.2 C87.2 FB6.2 R96.1 U6.1(VDD) U6.12(VDD) U6.13(VDD) U6.23(VDD) U6.24(VDD) U6.37(VDD) U6.38(VDD) U6.48(VDD)
EN_POWER_LTC2122: U14.4(EN) ; port En_Power_LTC2122
PG_LTC2122: R97.1 U14.5(PG) ; port PG_LTC2122
Vcc_2122_1.8V: C75.2 FB6.1 FB7.1 R98.2 U14.10(VOUT) U14.11(VOUT) U14.12(VOUT) U14.13(VOUT) U14.14(VOUT) ; port SPI_1V8_ADC  [project net SPI_1V8_ADC]
NetC73_2: C73.2 R96.2 U6.5(SENSE)
NetC74_2: C74.2 U6.6(VREF)
NetC92_1: C92.1 U14.7(SS)
NetR98_1: R98.1 R99.2 U14.9(ADJ)

Not connected (* = marked no-connect by the designer): U14 8(NC)*

### Layout directives
net class Power_Line: 2122_0VDD, 2122_VCC, SPI_1V8_ADC

### Notes on the sheet
- Układ	Piny 	V TYP	V MAX	I MAX [mA]	Opis
  LTC2122	VDD Two lane	1,8	1,9	459	Analog supply voltage
  OVDD	1,8	1,9	13,8		Output Supply Voltage
- 1A(2A)
- Title
- Size:
- Date:
- A3
- Number:
- Time:
- Revision:
- Sheet
- of
- File:

### Library data of the parts
C73 C74 = Capacitor: MURATA - GRM155R61A225KE95D - Keramikvielschichtkondensator, SMD, 2.2 µF, 10 V, 0402 [Metrisch 1005], ± 10%, X5R, Baureihe GRM; Material: Ceramic; Supplier 1: Digi-Key; Supplier Part Number 1: 490-10451-1-ND; Manufacturer: Murata; Manufacturer Part Number: GRM155R61A225KE95D; RoHS: Yes; Category: Ceramic Capacitors; Stock 1: 2215146; Pricing 1: 1=0,11000, 10=0,08100, 100=0,03800, 500=0,02664, 1000=0,02205, 2500=0,02052, 5000=0,01878 (USD); Mount: Surface Mount; Case/Package: 0402; Weight: 0.000212oz; Case Code (Metric): 1005; Min Operating Temperature: -55°C; Max Operating Temperature: 85°C; Dielectric: X5R; Termination: SMD/SMT; Voltage Rating (DC): 10V; Package Quantity: 10000; Capacitance: 2.2uF; Tolerance: 10%; Packaging: Tape and Reel; Length: 1mm; Height: 0.5mm; Thickness: 0.022inch; Depth: 0.5mm; Width: 0.5mm; REACH SVHC: No SVHC; Lead Free: Lead Free; ComponentLink1URL: http://www.mouser.com/ds/2/281/c02e-2905.pdf?src-supplier=Mouser; ComponentLink1Description: http://www.mouser.com/ds/2/281/c02e-2905.pdf?src-supplier=Mouser; ComponentLink2URL: http://components.arrow.com/part/dataview/0323_04264073?src-supplier=Arrow+Europe; ComponentLink2Description: http://components.arrow.com/part/dataview/0323_04264073?src-supplier=Arrow+Europe; ComponentLink3URL: http://www.farnell.com/datasheets/1872202.pdf?src-supplier=Farnell; ComponentLink3Description: http://www.farnell.com/datasheets/1872202.pdf?src-supplier=Farnell; ComponentLink4URL: http://www.farnell.com/datasheets/2047915.pdf?src-supplier=Farnell; ComponentLink4Description: http://www.farnell.com/datasheets/2047915.pdf?src-supplier=Farnell; ComponentLink5URL: http://www.farnell.com/datasheets/1872202.pdf?src-supplier=Element14; ComponentLink5Description: http://www.farnell.com/datasheets/1872202.pdf?src-supplier=Element14; ComponentLink6URL: http://www.farnell.com/datasheets/1872202.pdf?src-supplier=Newark; ComponentLink6Description: http://www.farnell.com/datasheets/1872202.pdf?src-supplier=Newark; ComponentLink7URL: http://psearch.en.murata.com/capacitor/product/GRM155R61A225KE95%23.pdf?src-supplier=Avnet; ComponentLink7Description: http://psearch.en.murata.com/capacitor/product/GRM155R61A225KE95%23.pdf?src-supplier=Avnet; ComponentLink8URL: http://www.farnell.com/datasheets/2047915.pdf?src-supplier=Element14; ComponentLink8Description: http://www.farnell.com/datasheets/2047915.pdf?src-supplier=Element14; ComponentLink9URL: https://search.murata.co.jp/Ceramy/image/img/A01X/G101/ENG/GRM155R61A225KE95-01.pdf?src-supplier=Digi-Key; ComponentLink9Description: https://search.murata.co.jp/Ceramy/image/img/A01X/G101/ENG/GRM155R61A225KE95-01.pdf?src-supplier=Digi-Key; ComponentLink10URL: http://www.farnell.com/datasheets/2047915.pdf?src-supplier=Newark; ComponentLink10Description: http://www.farnell.com/datasheets/2047915.pdf?src-supplier=Newark
C75 C76 C91 = Capacitor: TAIYO YUDEN - EMK107ABJ475MA-T - SMD Multilayer Ceramic Capacitor, 4.7 µF, 16 V, 0603 [1608 Metric], ± 20%, X5R, M Series; Supplier 1: Digi-Key; Supplier Part Number 1: 587-6003-1-ND; Manufacturer: Taiyo Yuden; Manufacturer Part Number: EMK107ABJ475MA-T; RoHS: Yes; Category: Ceramic Capacitors; Stock 1: 5; Pricing 1: 1=0,28000, 10=0,19200, 50=0,12820, 100=0,10900, 500=0,07696, 1000=0,06734 (USD); Mount: Surface Mount; Case/Package: Ceramic; Min Operating Temperature: -55°C; Max Operating Temperature: 85°C; Capacitance: 4.7uF; Tolerance: 20%; Packaging: Tape and Reel; Dielectric: X5R; Length: 1.6mm; Height: 0.8mm; Depth: 0.8mm; Radiation Hardening: No; Lead Free: Lead Free; ComponentLink1URL: https://datasheet.ciiva.com/26871/getdatasheetpartid-637315-26871304.pdf?src-supplier=Verical; ComponentLink1Description: https://datasheet.ciiva.com/26871/getdatasheetpartid-637315-26871304.pdf?src-supplier=Verical
C77-C85 C88-C90 C179 = Capacitor: Manufacturer 1: Murata; Manufacturer Part Number 1: GRM033R61C104ME84D; Tolerance: 20%; Dielectric: X5R; Supplier 1: Digi-Key; Supplier Part Number 1: 490-9986-1-ND; Stock 1: 503570; Pricing 1: 1=0.10000, 10=0.05400, 100=0.02430, 500=0.01732, 1000=0.01361, 2500=0.01238, 5000=0.01139 (USD); RoHS: Yes; Mount: Surface Mount; Weight: 1.2E-05oz; Case Code (Metric): 0603; Case Code (Imperial): 0201; Min Operating Temperature: -55°C; Max Operating Temperature: 85°C; Capacitance: 100nF; Packaging: Tape and Reel; Termination: SMD/SMT; Voltage Rating (DC): 16V; Package Quantity: 15000; Length: 0.024inch; Height: 0.3mm; Width: 0.3mm; Thickness: 0.013inch; ComponentLink1URL: http://www.mouser.com/ds/2/281/c02e-2905.pdf?src-supplier=Mouser; ComponentLink1Description: http://www.mouser.com/ds/2/281/c02e-2905.pdf?src-supplier=Mouser; ComponentLink2URL: http://search.murata.co.jp/Ceramy/image/img/A01X/G101/ENG/GRM033R61C104ME84-01.pdf?src-supplier=Digi-Key; ComponentLink2Description: http://search.murata.co.jp/Ceramy/image/img/A01X/G101/ENG/GRM033R61C104ME84-01.pdf?src-supplier=Digi-Key
C86 C87 = Capacitor: 0603 10 uF 16 V ±10% Tolerance X5R Multilayer Ceramic Capacitor; Manufacturer: Murata; Manufacturer Part Number: GRM188R61C106KAALJ; Supplier 1: Digi-Key; Supplier Part Number 1: 490-12736-1-ND; RoHS: Yes; Category: Ceramic Capacitors; Stock 1: 68393; Pricing 1: 1=0,43000, 10=0,29900, 100=0,17910, 500=0,13434, 1000=0,11345, 2500=0,10748, 5000=0,10150 (USD); Mount: Surface Mount; Weight: 0.000222oz; Case Code (Imperial): 0603; Case Code (Metric): 1608; Min Operating Temperature: -55°C; Max Operating Temperature: 85°C; Tolerance: 10%; Packaging: Tape and Reel; Capacitance: 10uF; Dielectric: X5R; Termination: SMD/SMT; Composition: Ceramic; Voltage Rating (DC): 16V; Package Quantity: 10000; Length: 0.063inch; Height: 0.8mm; Width: 0.031inch; Thickness: 0.037inch; ComponentLink1URL: http://www.mouser.com/ds/2/281/GRM188R61C106KAAL-01-1064790.pdf?src-supplier=Mouser; ComponentLink1Description: http://www.mouser.com/ds/2/281/GRM188R61C106KAAL-01-1064790.pdf?src-supplier=Mouser; ComponentLink2URL: http://search.murata.co.jp/Ceramy/image/img/A01X/G101/ENG/GRM188R61C106KAAL-01.pdf?src-supplier=Digi-Key; ComponentLink2Description: http://search.murata.co.jp/Ceramy/image/img/A01X/G101/ENG/GRM188R61C106KAAL-01.pdf?src-supplier=Digi-Key
C92 = Capacitor: Cap Ceramic 0.001uF 25V X7R 10% SMD 0201 125°C Paper T/R; Manufacturer: Murata; Manufacturer Part Number: GRM033R71E102KA01J; Supplier 1: Digi-Key; Supplier Part Number 1: 490-8161-1-ND; RoHS: Yes; Category: Ceramic Capacitors; Stock 1: 140332; Pricing 1: 1=0,10000, 10=0,02900, 100=0,01300, 500=0,00932, 1000=0,00732, 2500=0,00666, 5000=0,00612 (USD); Mount: Surface Mount; Case Code (Metric): 0603; Case Code (Imperial): 0201; Min Operating Temperature: -55°C; Max Operating Temperature: 125°C; Package Quantity: 50000; Packaging: Tape and Reel; Capacitance: 1nF; Tolerance: 10%; Voltage Rating: 25V; Voltage Rating (DC): 25V; Termination: SMD/SMT; Dielectric: X7R; Length: 0.6mm; Height: 0.3mm; Width: 0.012inch; Thickness: 0.013inch; Depth: 0.3mm; Radiation Hardening: No; ComponentLink1URL: https://datasheet.ciiva.com/5453/product-5453157.pdf?src-supplier=Mouser; ComponentLink1Description: https://datasheet.ciiva.com/5453/product-5453157.pdf?src-supplier=Mouser; ComponentLink2URL: https://datasheet.ciiva.com/11621/product-11621675.pdf?src-supplier=Avnet; ComponentLink2Description: https://datasheet.ciiva.com/11621/product-11621675.pdf?src-supplier=Avnet
FB6 = Ferrite: FERRITE BEAD 120 OHM 0402 1LN; Manufacturer: Murata; Manufacturer Part Number: BLM15BB121SN1D; Material: Ferrite,Steel; Tolerance: 25%; Current Rating: 300mA; DC Resistance (DCR): 550mR; Test Frequency: 100MHz; Shielding: Unshielded; Number of Lines: 1; Supplier 1: Digi-Key; Supplier Part Number 1: 490-1008-1-ND; RoHS: Yes; Category: Inductors; Stock 1: 72662; Pricing 1: 1=0,10000, 10=0,08300, 25=0,07440, 50=0,05440, 100=0,04700, 250=0,03712, 500=0,03136, 1000=0,02640, 5000=0,02351 (USD); Case/Package: 0402; Number of Pins: 2; Case Code (Metric): 1005; Case Code (Imperial): 0402; Core Material: Ferrite; Min Operating Temperature: -55°C; Max Operating Temperature: 125°C; Package Quantity: 1; Packaging: Tape and Reel; Max DC Current: 300mA; Termination: SMD/SMT; Frequency: 100MHz; Resistor Type: Ferrite Bead; Impedance: 120R; Max Current Rating: 300mA; Number of Circuits: 1; Length: 1mm; Height: 0.5mm; Width: 0.5mm; Depth: 0.5mm; Lead Free: Lead Free; REACH SVHC: No SVHC; ComponentLink1URL: https://datasheet.ciiva.com/1466/5145-1466832.pdf?src-supplier=Element14; ComponentLink1Description: https://datasheet.ciiva.com/1466/5145-1466832.pdf?src-supplier=Element14; ComponentLink2URL: https://datasheet.ciiva.com/41449/001172179-da-01-en-drossel-0402-120r-1-0x0-5mm-10000st-41449466.pdf?src-supplier=Conrad; ComponentLink2Description: https://datasheet.ciiva.com/41449/001172179-da-01-en-drossel-0402-120r-1-0x0-5mm-10000st-41449466.pdf?src-supplier=Conrad; ComponentLink3URL: https://datasheet.ciiva.com/1466/5145-1466833.pdf?src-supplier=Element14; ComponentLink3Description: https://datasheet.ciiva.com/1466/5145-1466833.pdf?src-supplier=Element14; ComponentLink4URL: https://datasheet.ciiva.com/3082/l0110s0100blm15b-3082680.pdf?src-supplier=Avnet; ComponentLink4Description: https://datasheet.ciiva.com/3082/l0110s0100blm15b-3082680.pdf?src-supplier=Avnet; ComponentLink5URL: https://datasheet.ciiva.com/16213/l0110s0100blm15b-16213674.pdf?src-supplier=Future+Electronics; ComponentLink5Description: https://datasheet.ciiva.com/16213/l0110s0100blm15b-16213674.pdf?src-supplier=Future+Electronics; ComponentLink6URL: https://datasheet.ciiva.com/1012/l0110s0100blm15b-1012029.pdf?src-supplier=Digi-Key; ComponentLink6Description: https://datasheet.ciiva.com/1012/l0110s0100blm15b-1012029.pdf?src-supplier=Digi-Key; ComponentLink7URL: https://datasheet.ciiva.com/1012/l0110s0100blm15b-1012030.pdf?src-supplier=Digi-Key; ComponentLink7Description: https://datasheet.ciiva.com/1012/l0110s0100blm15b-1012030.pdf?src-supplier=Digi-Key; ComponentLink8URL: https://datasheet.ciiva.com/1012/l0110s0100blm15b-1012031.pdf?src-supplier=Digi-Key; ComponentLink8Description: https://datasheet.ciiva.com/1012/l0110s0100blm15b-1012031.pdf?src-supplier=Digi-Key
FB7 = Ferrite: MURATA - BLM31PG330SN1L - Koralik ferrytowy, 1206 [jedn. metryczne: 3216], 33 ohm, 6 A, EMIFIL BLM31P Series, 0.009 ohm; Material: Steel,Ferrite; Tolerance: 25%; Number of Lines: 1; Max Current Rating: 6A; DC Resistance (DCR): 9mR; Test Frequency: 100MHz; Shielding: Unshielded; Supplier 1: Digi-Key; Manufacturer: Murata; Manufacturer Part Number: BLM31PG330SN1L; RoHS: Yes; Category: Ferrite Beads and Chips; Stock 1: 56200; Pricing 1: 1=0,31000, 10=0,24100, 25=0,19920, 50=0,17180, 100=0,15470, 250=0,13064, 500=0,11688, 1000=0,09969 (USD); Case/Package: 1206; Number of Pins: 2; Case Code (Metric): 3216; Case Code (Imperial): 1206; Contact Plating: Tin,Matte; Min Operating Temperature: -55°C; Max Operating Temperature: 125°C; Impedance: 33R; Package Quantity: 1; Packaging: Tape and Reel; Current Rating: 6A; Max DC Current: 6A; Termination: Flat; Length: 3.2mm; Height: 1.1mm; Width: 1.6mm; Depth: 1.6mm; Lead Free: Lead Free; ComponentLink1URL: https://datasheet.ciiva.com/11799/0900766b811b5866-11799415.pdf?src-supplier=RSComponents; ComponentLink1Description: https://datasheet.ciiva.com/11799/0900766b811b5866-11799415.pdf?src-supplier=RSComponents; ComponentLink2URL: https://datasheet.ciiva.com/41449/001172384-da-01-en-drossel-1206-33r0-3-2x1-60mm-3000st-41449553.pdf?src-supplier=Conrad; ComponentLink2Description: https://datasheet.ciiva.com/41449/001172384-da-01-en-drossel-1206-33r0-3-2x1-60mm-3000st-41449553.pdf?src-supplier=Conrad; ComponentLink3URL: https://datasheet.ciiva.com/41449/001171745-da-01-en-chip-drossel1206-33r0-6000ma-3-2x1-60mm-41449400.pdf?src-supplier=Conrad; ComponentLink3Description: https://datasheet.ciiva.com/41449/001171745-da-01-en-chip-drossel1206-33r0-6000ma-3-2x1-60mm-41449400.pdf?src-supplier=Conrad; ComponentLink4URL: https://datasheet.ciiva.com/6211/l0110s0100blm31p-6211896.pdf?src-supplier=Digi-Key; ComponentLink4Description: https://datasheet.ciiva.com/6211/l0110s0100blm31p-6211896.pdf?src-supplier=Digi-Key; ComponentLink5URL: https://datasheet.ciiva.com/14122/apblm31p-data-e-14122216.pdf?src-supplier=Distrelec; ComponentLink5Description: https://datasheet.ciiva.com/14122/apblm31p-data-e-14122216.pdf?src-supplier=Distrelec; ComponentLink6URL: https://datasheet.ciiva.com/6211/l0110s0100blm31p-6211899.pdf?src-supplier=Digi-Key; ComponentLink6Description: https://datasheet.ciiva.com/6211/l0110s0100blm31p-6211899.pdf?src-supplier=Digi-Key; ComponentLink7URL: https://datasheet.ciiva.com/16205/l0110s0100blm31p-16205563.pdf?src-supplier=Future+Electronics; ComponentLink7Description: https://datasheet.ciiva.com/16205/l0110s0100blm31p-16205563.pdf?src-supplier=Future+Electronics; ComponentLink8URL: https://datasheet.ciiva.com/6211/l0110s0100blm31p-6211900.pdf?src-supplier=Digi-Key; ComponentLink8Description: https://datasheet.ciiva.com/6211/l0110s0100blm31p-6211900.pdf?src-supplier=Digi-Key; ComponentLink9URL: https://datasheet.ciiva.com/3067/c31e-3067133.pdf?src-supplier=Avnet; ComponentLink9Description: https://datasheet.ciiva.com/3067/c31e-3067133.pdf?src-supplier=Avnet; ComponentLink10URL: https://datasheet.ciiva.com/3067/c31e-3067134.pdf?src-supplier=Avnet; ComponentLink10Description: https://datasheet.ciiva.com/3067/c31e-3067134.pdf?src-supplier=Avnet; ComponentLink11URL: https://datasheet.ciiva.com/16552/c31e-16552158.pdf?src-supplier=Avnet+Europe; ComponentLink11Description: https://datasheet.ciiva.com/16552/c31e-16552158.pdf?src-supplier=Avnet+Europe
R96 = Resistor: Manufacturer 1: Yageo; Manufacturer Part Number 1: RC0402FR-071KL; Tolerance: 1%; Temperature Coefficient: 100ppm/°C; Power Rating: 62.5mW; Voltage Rating: 50V; Supplier 1: Digi-Key; Supplier Part Number 1: 311-1.00KLRCT-ND; Stock 1: 57541929; Pricing 1: 1=0,10000, 10=0,01600, 100=0,00640, 1000=0,00289, 2500=0,00251, 5000=0,00207 (USD); RoHS: Yes; Number of Pins: 2; Case Code (Imperial): 0402; Case Code (Metric): 1005; Min Operating Temperature: -55°C; Max Operating Temperature: 155°C; Packaging: Tape and Reel; Resistance: 1kR; Composition: Thick Film; Voltage Rating (DC): 50V; Termination: SMD/SMT; Military Standard: Not; Length: 1mm; Height: 0.32mm; Width: 0.5mm; Depth: 0.5mm; REACH SVHC: Unknown; Lead Free: Lead Free; ComponentLink1URL: https://datasheet.ciiva.com/11819/0900766b80c66297-11819477.pdf?src-supplier=RSComponents; ComponentLink1Description: https://datasheet.ciiva.com/11819/0900766b80c66297-11819477.pdf?src-supplier=RSComponents; ComponentLink2URL: https://datasheet.ciiva.com/12666/pyu-rc0402-51-rohs-l-6-r-12666741.pdf?src-supplier=Mouser; ComponentLink2Description: https://datasheet.ciiva.com/12666/pyu-rc0402-51-rohs-l-6-r-12666741.pdf?src-supplier=Mouser; ComponentLink3URL: https://datasheet.ciiva.com/17063/pyu-rc0402-51-rohs-l-6-r-17063193.pdf?src-supplier=Future+Electronics; ComponentLink3Description: https://datasheet.ciiva.com/17063/pyu-rc0402-51-rohs-l-6-r-17063193.pdf?src-supplier=Future+Electronics; ComponentLink4URL: https://datasheet.ciiva.com/22747/1018594-22747513.pdf?src-supplier=Element14; ComponentLink4Description: https://datasheet.ciiva.com/22747/1018594-22747513.pdf?src-supplier=Element14; ComponentLink5URL: https://datasheet.ciiva.com/7849/1018594-7849869.pdf?src-supplier=Element14; ComponentLink5Description: https://datasheet.ciiva.com/7849/1018594-7849869.pdf?src-supplier=Element14; ComponentLink6URL: https://datasheet.ciiva.com/7983/1018594-7983502.pdf?src-supplier=Element14; ComponentLink6Description: https://datasheet.ciiva.com/7983/1018594-7983502.pdf?src-supplier=Element14; ComponentLink7URL: https://datasheet.ciiva.com/7849/1018594-7849871.pdf?src-supplier=Element14; ComponentLink7Description: https://datasheet.ciiva.com/7849/1018594-7849871.pdf?src-supplier=Element14
R97 R98 = Resistor: Manufacturer 1: Yageo; Manufacturer Part Number 1: RC0402FR-07100KL; Power Rating: 63mW; Tolerance: 1%; Voltage Rating: 50V; Temperature Coefficient: 100ppm/°C; Supplier 1: Digi-Key; Supplier Part Number 1: 311-100KLRCT-ND; Stock 1: 51358973; Pricing 1: 1=0,10000, 10=0,01500, 100=0,00600, 1000=0,00270, 2500=0,00235, 5000=0,00194 (USD); RoHS: Yes; Case Code (Metric): 1005; Case Code (Imperial): 0402; Min Operating Temperature: -55°C; Max Operating Temperature: 155°C; Resistance: 100kR; Packaging: Tape and Reel; Composition: Thick Film; Termination: SMD/SMT; Military Standard: Not; Number of Terminations: 2; Working Voltage: 50V; Package Quantity: 1; Max Power Dissipation: 63mW; Features: Moisture Resistant; Length: 0.039inch; Height: 0.016inch; Width: 0.02inch; Depth: 0.5mm; REACH SVHC: No SVHC; Lead Free: Lead Free; ComponentLink1URL: https://datasheet.ciiva.com/11819/0900766b80c66297-11819452.pdf?src-supplier=RSComponents; ComponentLink1Description: https://datasheet.ciiva.com/11819/0900766b80c66297-11819452.pdf?src-supplier=RSComponents; ComponentLink2URL: https://datasheet.ciiva.com/2453/pyu-r-int-thick-7-2453361.pdf?src-supplier=Digi-Key; ComponentLink2Description: https://datasheet.ciiva.com/2453/pyu-r-int-thick-7-2453361.pdf?src-supplier=Digi-Key; ComponentLink3URL: https://datasheet.ciiva.com/2453/pyu-r-int-thick-7-2453362.pdf?src-supplier=Digi-Key; ComponentLink3Description: https://datasheet.ciiva.com/2453/pyu-r-int-thick-7-2453362.pdf?src-supplier=Digi-Key; ComponentLink4URL: https://datasheet.ciiva.com/2453/pyu-r-int-thick-7-2453363.pdf?src-supplier=Digi-Key; ComponentLink4Description: https://datasheet.ciiva.com/2453/pyu-r-int-thick-7-2453363.pdf?src-supplier=Digi-Key; ComponentLink5URL: https://datasheet.ciiva.com/22747/1018594-22747509.pdf?src-supplier=Element14; ComponentLink5Description: https://datasheet.ciiva.com/22747/1018594-22747509.pdf?src-supplier=Element14; ComponentLink6URL: https://datasheet.ciiva.com/15189/getdatasheetpartid-323696-15189334.pdf?src-supplier=Verical; ComponentLink6Description: https://datasheet.ciiva.com/15189/getdatasheetpartid-323696-15189334.pdf?src-supplier=Verical; ComponentLink7URL: https://datasheet.ciiva.com/12667/pyu-rc0402-51-rohs-l-6-r-12667930.pdf?src-supplier=Mouser; ComponentLink7Description: https://datasheet.ciiva.com/12667/pyu-rc0402-51-rohs-l-6-r-12667930.pdf?src-supplier=Mouser
R99 = Resistor: RT Series 0402 0.063 W 38.3 kOhms 0.5% ±50 ppm/°C SMT Thin Film Chip Resistor; Manufacturer: Yageo; Manufacturer Part Number: RT0402DRE0738K3L; Voltage Rating (DC): 50V; Power Rating: 63mW; Supplier 1: Digi-Key; Supplier Part Number 1: 311-2278-1-ND; RoHS: Yes; Category: Chip SMD Resistors; Stock 1: 29268; Pricing 1: 1=0,20000, 10=0,16800, 100=0,06570, 1000=0,02750, 2500=0,02521, 5000=0,02292 (USD); Case Code (Metric): 1005; Case Code (Imperial): 0402; Min Operating Temperature: -55°C; Max Operating Temperature: 155°C; Features: Moisture Resistant; Resistance: 38.3kR; Tolerance: 0.5%; Packaging: Tape and Reel; Composition: Thin Film; Number of Terminations: 2; Max Power Dissipation: 63mW; Temperature Coefficient: 50ppm/°C; Length: 0.039inch; Height: 0.014inch; Width: 0.02inch; Lead Free: Lead Free; ComponentLink1URL: http://www.yageo.com/documents/recent/PYu-RT_1-to-0.01_RoHS_L_9.pdf?src-supplier=Digi-Key; ComponentLink1Description: http://www.yageo.com/documents/recent/PYu-RT_1-to-0.01_RoHS_L_9.pdf?src-supplier=Digi-Key; ComponentLink2URL: http://www.yageo.com/documents/recent/PYu-RT_1-to-0.05_RoHS_L_(4).pdf?src-supplier=Future+Electronics; ComponentLink2Description: http://www.yageo.com/documents/recent/PYu-RT_1-to-0.05_RoHS_L_(4).pdf?src-supplier=Future+Electronics
U6 = LTC2122IUK#PBF: IC ADC 14BIT 170MSPS 48QFN; Manufacturer: Analog Devices / Linear Technology; Number of Bits: 14; Sampling Rate: 170000000S/s; Number of Inputs: 2; Min Supply Voltage: 1.7V; Max Supply Voltage: 1.9V; Interface: SPI; Resolution: 14b; Supplier 1: Digi-Key; Manufacturer Part Number: LTC2122IUK#PBF; RoHS: Yes; Category: Analog to Digital Converters (ADCs); Stock 1: 52; Pricing 1: 1=105,29000, 25=102,14040 (USD); Case/Package: QFN; Number of Pins: 48; Min Operating Temperature: -40°C; Max Operating Temperature: 85°C; Packaging: Tray; Number of A/D Converters: 2; REACH SVHC: No SVHC; ComponentLink1URL: http://www.linear.com/docs/45350?src-supplier=Digi-Key; ComponentLink1Description: http://www.linear.com/docs/45350?src-supplier=Digi-Key; ComponentLink2URL: http://www.farnell.com/datasheets/1968213.pdf?src-supplier=Element14; ComponentLink2Description: http://www.farnell.com/datasheets/1968213.pdf?src-supplier=Element14
U14 = ADP1741ACPZ-R7: 2 A, Low VIN, Low Dropout Linear Regulator, 1.6 to 3.6 V Vin, 0.75 to 3 V Vout, Industrial, 16-pin QFN (CP-16-13), Reel; Manufacturer: Analog Devices; Iout max: 2A; Supply Current IGND @ Small Load: 90uA; Vin (max) (V): 3.6; Vin (min) (V): 1.6; Vout Adjustable Range: 0.75V to 3.3V; DatasheetVersion: Rev. D; PackageVersion: 031006-A, 06/2006; PackageReference: CP-16-13; PackageDescription: 16-Pin Lead Frame Chip Scale Package, Body 4 x 4 mm, Pitch 0.65 mm; Supplier 1: Digi-Key; Supplier Part Number 1: ADP1741ACPZ-R7TR-ND; Supplier 2: Digi-Key; Supplier Part Number 2: ADP1741ACPZ-R7CT-ND; Supplier 3: Digi-Key; Supplier Part Number 3: ADP1741ACPZ-R7DKR-ND; Supplier 4: Newark; Supplier Part Number 4: 72W4083; Supplier 5: Newark; Supplier Part Number 5: 34P3050; Supplier 6: Mouser; Supplier Part Number 6: 584-ADP1741ACPZ-R7; Packing: Reel; Mounting Technology: Surface Mount; Code_JEDEC: MO-220-VGGC.; PartNumber: ADP1741ACPZ-R7; ComponentLink1Description: Manufacturer URL; ComponentLink1URL: http://www.analog.com/en/index.html; ComponentLink2Description: Datasheet; ComponentLink2URL: http://www.analog.com/static/imported-files/data_sheets/ADP1740_1741.pdf; ComponentLink3Description: Package Specification; ComponentLink3URL: http://www.analog.com/static/imported-files/packages/PKG_PDF/LFCSP(CP)/CP-16/CP_16_13.pdf; ComponentLink4Description: URL Link1; ComponentLink4URL: Product URL:http://www.analog.com/en/ADP1741/productSearch.html